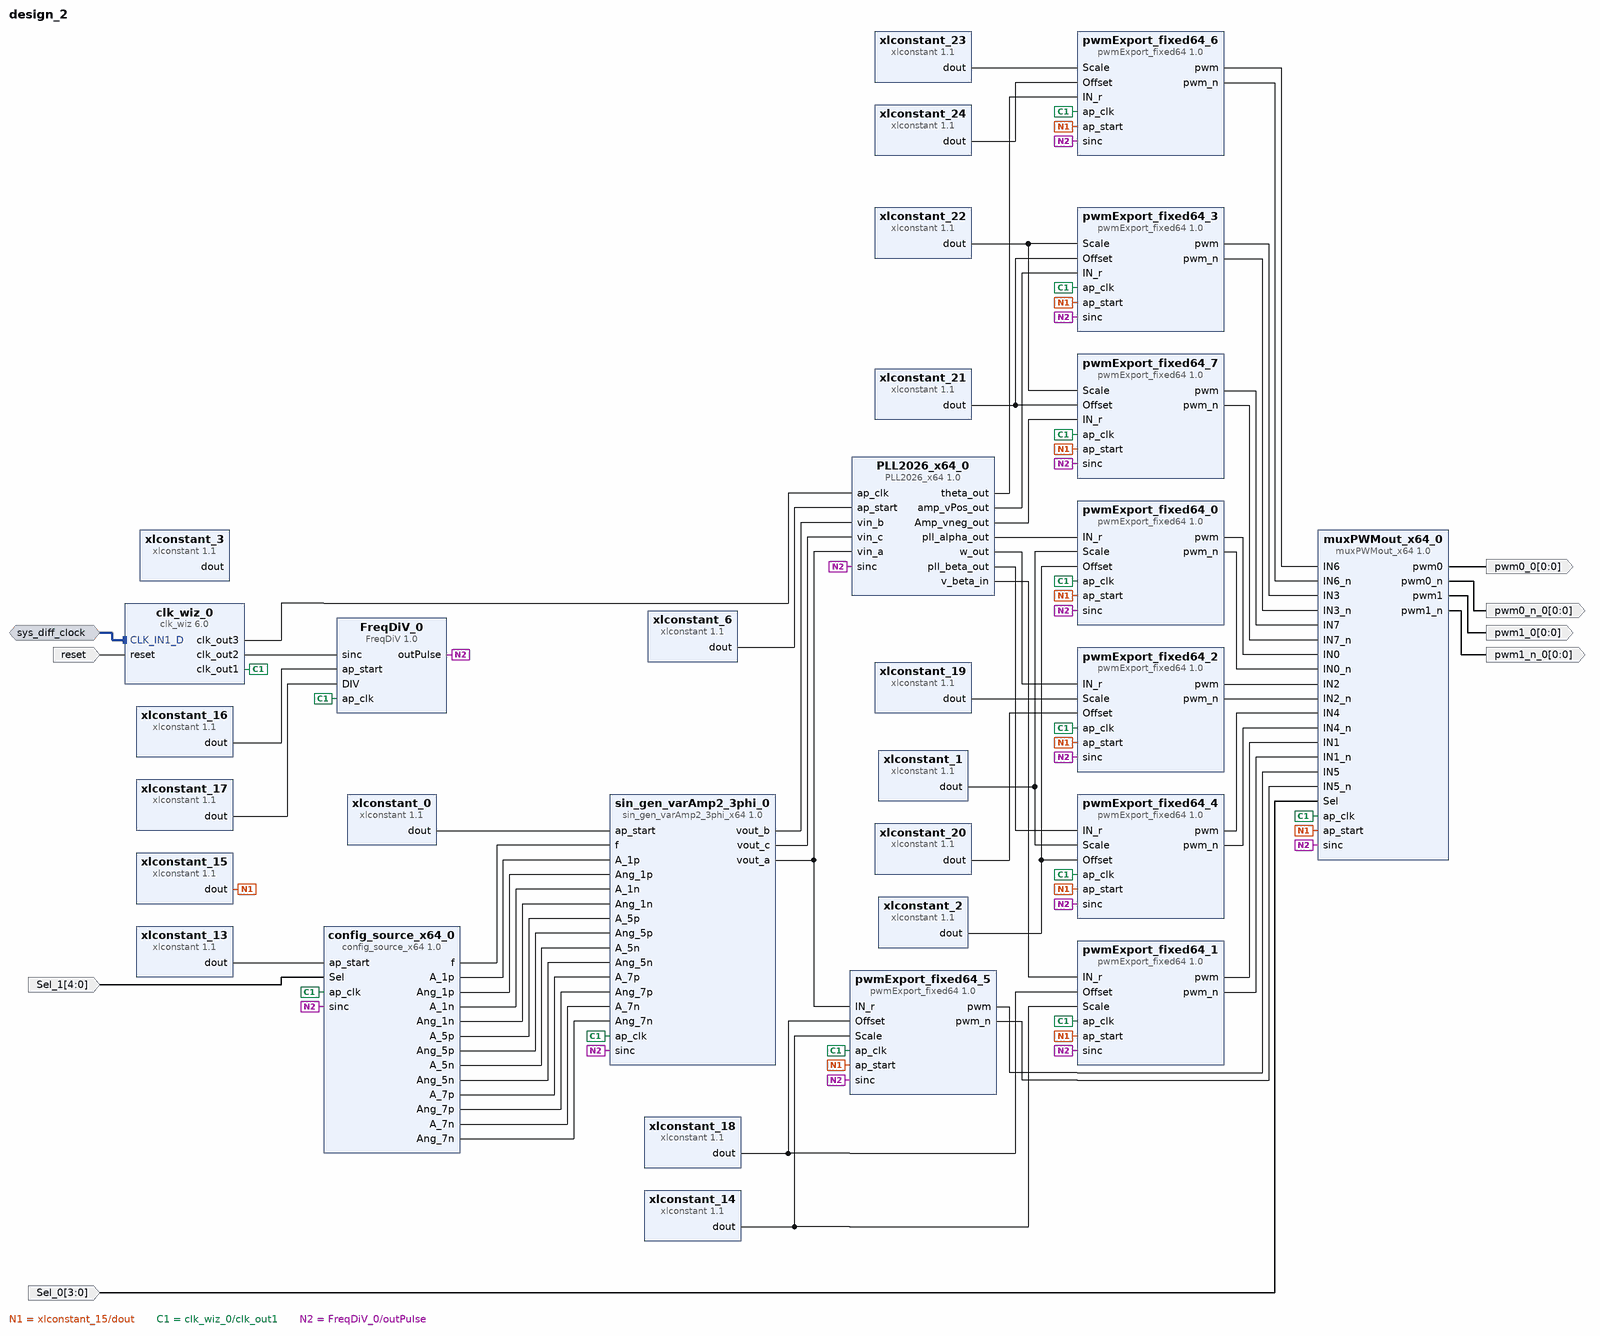
[diagram p0: block diagram of the top level]
# Vivado block design design_2, xc7a200tfbg676-2, Vivado 2020.2
create_bd_design design_2

create_bd_intf_port -mode Slave -vlnv xilinx.com:interface:diff_clock_rtl:1.0 sys_diff_clock
set_property -dict {CONFIG.FREQ_HZ 200000000} [get_bd_intf_ports sys_diff_clock]
create_bd_port -dir I -from 3 -to 0 Sel_0
create_bd_port -dir I -from 4 -to 0 Sel_1
create_bd_port -dir O -from 0 -to 0 pwm0_0
create_bd_port -dir O -from 0 -to 0 pwm0_n_0
create_bd_port -dir O -from 0 -to 0 pwm1_0
create_bd_port -dir O -from 0 -to 0 pwm1_n_0
create_bd_port -dir I -type rst reset
set_property -dict {CONFIG.POLARITY ACTIVE_HIGH} [get_bd_ports reset]

create_bd_cell -type ip -vlnv xilinx.com:ip:xlconstant:1.1 xlconstant_0
create_bd_cell -type ip -vlnv xilinx.com:ip:xlconstant:1.1 xlconstant_3
set_property -dict {CONFIG.CONST_VAL 0x19000000000000 CONFIG.CONST_WIDTH 64} [get_bd_cells xlconstant_3]
create_bd_cell -type ip -vlnv xilinx.com:ip:xlconstant:1.1 xlconstant_6
create_bd_cell -type ip -vlnv xilinx.com:ip:clk_wiz:6.0 clk_wiz_0
set_property -dict [list \
  CONFIG.CLKOUT1_JITTER 112.316 \
  CONFIG.CLKOUT1_PHASE_ERROR 89.971 \
  CONFIG.CLKOUT2_JITTER 178.053 \
  CONFIG.CLKOUT2_PHASE_ERROR 89.971 \
  CONFIG.CLKOUT2_REQUESTED_OUT_FREQ 10.000 \
  CONFIG.CLKOUT2_USED true \
  CONFIG.CLKOUT3_JITTER 129.198 \
  CONFIG.CLKOUT3_PHASE_ERROR 89.971 \
  CONFIG.CLKOUT3_REQUESTED_OUT_FREQ 50 \
  CONFIG.CLKOUT3_USED true \
  CONFIG.CLK_IN1_BOARD_INTERFACE sys_diff_clock \
  CONFIG.MMCM_CLKFBOUT_MULT_F 5.000 \
  CONFIG.MMCM_CLKOUT0_DIVIDE_F 10.000 \
  CONFIG.MMCM_CLKOUT1_DIVIDE 100 \
  CONFIG.MMCM_CLKOUT2_DIVIDE 20 \
  CONFIG.NUM_OUT_CLKS 3 \
  CONFIG.RESET_BOARD_INTERFACE reset \
  CONFIG.USE_BOARD_FLOW true \
] [get_bd_cells clk_wiz_0]
create_bd_cell -type ip -vlnv xilinx.com:user:pwmExport_fixed64:1.0 pwmExport_fixed64_0
create_bd_cell -type ip -vlnv xilinx.com:user:muxPWMout_x64:1.0 muxPWMout_x64_0
create_bd_cell -type ip -vlnv xilinx.com:user:pwmExport_fixed64:1.0 pwmExport_fixed64_1
create_bd_cell -type ip -vlnv xilinx.com:user:pwmExport_fixed64:1.0 pwmExport_fixed64_2
create_bd_cell -type ip -vlnv xilinx.com:user:pwmExport_fixed64:1.0 pwmExport_fixed64_3
create_bd_cell -type ip -vlnv xilinx.com:user:pwmExport_fixed64:1.0 pwmExport_fixed64_4
create_bd_cell -type ip -vlnv xilinx.com:user:pwmExport_fixed64:1.0 pwmExport_fixed64_5
create_bd_cell -type ip -vlnv xilinx.com:user:pwmExport_fixed64:1.0 pwmExport_fixed64_6
create_bd_cell -type ip -vlnv xilinx.com:user:pwmExport_fixed64:1.0 pwmExport_fixed64_7
create_bd_cell -type ip -vlnv xilinx.com:ip:xlconstant:1.1 xlconstant_15
create_bd_cell -type ip -vlnv xilinx.com:user:FreqDiV:1.0 FreqDiV_0
create_bd_cell -type ip -vlnv xilinx.com:ip:xlconstant:1.1 xlconstant_16
create_bd_cell -type ip -vlnv xilinx.com:ip:xlconstant:1.1 xlconstant_17
set_property -dict {CONFIG.CONST_VAL 10 CONFIG.CONST_WIDTH 32} [get_bd_cells xlconstant_17]
create_bd_cell -type ip -vlnv xilinx.com:user:config_source_x64:1.0 config_source_x64_0
create_bd_cell -type ip -vlnv xilinx.com:ip:xlconstant:1.1 xlconstant_13
create_bd_cell -type ip -vlnv xilinx.com:ip:xlconstant:1.1 xlconstant_1
set_property -dict {CONFIG.CONST_VAL 0x55000000000000 CONFIG.CONST_WIDTH 64} [get_bd_cells xlconstant_1]
create_bd_cell -type ip -vlnv xilinx.com:ip:xlconstant:1.1 xlconstant_2
set_property -dict {CONFIG.CONST_VAL 0 CONFIG.CONST_WIDTH 64} [get_bd_cells xlconstant_2]
create_bd_cell -type ip -vlnv xilinx.com:ip:xlconstant:1.1 xlconstant_14
set_property -dict {CONFIG.CONST_VAL 0x1800000000000 CONFIG.CONST_WIDTH 64} [get_bd_cells xlconstant_14]
create_bd_cell -type ip -vlnv xilinx.com:ip:xlconstant:1.1 xlconstant_18
set_property -dict {CONFIG.CONST_VAL 0 CONFIG.CONST_WIDTH 64} [get_bd_cells xlconstant_18]
create_bd_cell -type ip -vlnv xilinx.com:ip:xlconstant:1.1 xlconstant_19
set_property -dict {CONFIG.CONST_VAL 0xcccccccccccc CONFIG.CONST_WIDTH 64} [get_bd_cells xlconstant_19]
create_bd_cell -type ip -vlnv xilinx.com:ip:xlconstant:1.1 xlconstant_20
set_property -dict {CONFIG.CONST_VAL 0xfed4000000000000 CONFIG.CONST_WIDTH 64} [get_bd_cells xlconstant_20]
create_bd_cell -type ip -vlnv xilinx.com:ip:xlconstant:1.1 xlconstant_21
set_property -dict {CONFIG.CONST_VAL 0x3553f7ced9168 CONFIG.CONST_WIDTH 64} [get_bd_cells xlconstant_21]
create_bd_cell -type ip -vlnv xilinx.com:ip:xlconstant:1.1 xlconstant_22
set_property -dict {CONFIG.CONST_VAL 0x3553f7ced9168 CONFIG.CONST_WIDTH 64} [get_bd_cells xlconstant_22]
create_bd_cell -type ip -vlnv xilinx.com:ip:xlconstant:1.1 xlconstant_23
set_property -dict {CONFIG.CONST_VAL 0x19000000000000 CONFIG.CONST_WIDTH 64} [get_bd_cells xlconstant_23]
create_bd_cell -type ip -vlnv xilinx.com:ip:xlconstant:1.1 xlconstant_24
set_property -dict {CONFIG.CONST_VAL 0xffb5000000000000 CONFIG.CONST_WIDTH 64} [get_bd_cells xlconstant_24]
create_bd_cell -type ip -vlnv xilinx.com:user:sin_gen_varAmp2_3phi_x64:1.0 sin_gen_varAmp2_3phi_0
create_bd_cell -type ip -vlnv xilinx.com:user:PLL2026_x64:1.0 PLL2026_x64_0

# ---- connections ----

connect_bd_intf_net [get_bd_intf_ports sys_diff_clock] [get_bd_intf_pins clk_wiz_0/CLK_IN1_D]
connect_bd_net [get_bd_pins xlconstant_0/dout] [get_bd_pins sin_gen_varAmp2_3phi_0/ap_start]
connect_bd_net [get_bd_pins sin_gen_varAmp2_3phi_0/vout_a] [get_bd_pins pwmExport_fixed64_5/IN_r] [get_bd_pins PLL2026_x64_0/vin_a]
connect_bd_net [get_bd_pins sin_gen_varAmp2_3phi_0/vout_b] [get_bd_pins PLL2026_x64_0/vin_b]
connect_bd_net [get_bd_pins sin_gen_varAmp2_3phi_0/vout_c] [get_bd_pins PLL2026_x64_0/vin_c]
# net xlconstant_3_dout has one end: xlconstant_3/dout
connect_bd_net [get_bd_pins xlconstant_6/dout] [get_bd_pins PLL2026_x64_0/ap_start]
connect_bd_net [get_bd_pins pwmExport_fixed64_0/pwm] [get_bd_pins muxPWMout_x64_0/IN0]
connect_bd_net [get_bd_pins pwmExport_fixed64_1/pwm] [get_bd_pins muxPWMout_x64_0/IN1]
connect_bd_net [get_bd_pins pwmExport_fixed64_2/pwm] [get_bd_pins muxPWMout_x64_0/IN2]
connect_bd_net [get_bd_pins pwmExport_fixed64_3/pwm] [get_bd_pins muxPWMout_x64_0/IN3]
connect_bd_net [get_bd_pins pwmExport_fixed64_4/pwm] [get_bd_pins muxPWMout_x64_0/IN4]
connect_bd_net [get_bd_pins pwmExport_fixed64_5/pwm] [get_bd_pins muxPWMout_x64_0/IN5]
connect_bd_net [get_bd_pins pwmExport_fixed64_6/pwm] [get_bd_pins muxPWMout_x64_0/IN6]
connect_bd_net [get_bd_pins pwmExport_fixed64_7/pwm] [get_bd_pins muxPWMout_x64_0/IN7]
connect_bd_net [get_bd_pins pwmExport_fixed64_0/pwm_n] [get_bd_pins muxPWMout_x64_0/IN0_n]
connect_bd_net [get_bd_pins pwmExport_fixed64_1/pwm_n] [get_bd_pins muxPWMout_x64_0/IN1_n]
connect_bd_net [get_bd_pins pwmExport_fixed64_2/pwm_n] [get_bd_pins muxPWMout_x64_0/IN2_n]
connect_bd_net [get_bd_pins pwmExport_fixed64_3/pwm_n] [get_bd_pins muxPWMout_x64_0/IN3_n]
connect_bd_net [get_bd_pins pwmExport_fixed64_4/pwm_n] [get_bd_pins muxPWMout_x64_0/IN4_n]
connect_bd_net [get_bd_pins pwmExport_fixed64_5/pwm_n] [get_bd_pins muxPWMout_x64_0/IN5_n]
connect_bd_net [get_bd_pins pwmExport_fixed64_6/pwm_n] [get_bd_pins muxPWMout_x64_0/IN6_n]
connect_bd_net [get_bd_pins pwmExport_fixed64_7/pwm_n] [get_bd_pins muxPWMout_x64_0/IN7_n]
connect_bd_net -net Sel_0_1 [get_bd_ports Sel_0] [get_bd_pins muxPWMout_x64_0/Sel]
connect_bd_net [get_bd_pins xlconstant_15/dout] \
  [get_bd_pins muxPWMout_x64_0/ap_start] [get_bd_pins pwmExport_fixed64_0/ap_start] \
  [get_bd_pins pwmExport_fixed64_1/ap_start] [get_bd_pins pwmExport_fixed64_2/ap_start] \
  [get_bd_pins pwmExport_fixed64_3/ap_start] [get_bd_pins pwmExport_fixed64_4/ap_start] \
  [get_bd_pins pwmExport_fixed64_5/ap_start] [get_bd_pins pwmExport_fixed64_6/ap_start] \
  [get_bd_pins pwmExport_fixed64_7/ap_start]
connect_bd_net [get_bd_pins clk_wiz_0/clk_out1] \
  [get_bd_pins pwmExport_fixed64_0/ap_clk] [get_bd_pins pwmExport_fixed64_1/ap_clk] [get_bd_pins pwmExport_fixed64_2/ap_clk] \
  [get_bd_pins pwmExport_fixed64_3/ap_clk] [get_bd_pins pwmExport_fixed64_4/ap_clk] [get_bd_pins pwmExport_fixed64_5/ap_clk] \
  [get_bd_pins pwmExport_fixed64_6/ap_clk] [get_bd_pins pwmExport_fixed64_7/ap_clk] [get_bd_pins FreqDiV_0/ap_clk] \
  [get_bd_pins muxPWMout_x64_0/ap_clk] [get_bd_pins config_source_x64_0/ap_clk] [get_bd_pins sin_gen_varAmp2_3phi_0/ap_clk]
connect_bd_net [get_bd_pins xlconstant_16/dout] [get_bd_pins FreqDiV_0/ap_start]
connect_bd_net [get_bd_pins clk_wiz_0/clk_out2] [get_bd_pins FreqDiV_0/sinc]
connect_bd_net [get_bd_pins xlconstant_17/dout] [get_bd_pins FreqDiV_0/DIV]
connect_bd_net [get_bd_pins FreqDiV_0/outPulse] \
  [get_bd_pins pwmExport_fixed64_0/sinc] [get_bd_pins pwmExport_fixed64_1/sinc] [get_bd_pins pwmExport_fixed64_2/sinc] \
  [get_bd_pins pwmExport_fixed64_3/sinc] [get_bd_pins pwmExport_fixed64_4/sinc] [get_bd_pins pwmExport_fixed64_5/sinc] \
  [get_bd_pins pwmExport_fixed64_6/sinc] [get_bd_pins pwmExport_fixed64_7/sinc] [get_bd_pins muxPWMout_x64_0/sinc] \
  [get_bd_pins config_source_x64_0/sinc] [get_bd_pins sin_gen_varAmp2_3phi_0/sinc] [get_bd_pins PLL2026_x64_0/sinc]
connect_bd_net [get_bd_pins config_source_x64_0/f] [get_bd_pins sin_gen_varAmp2_3phi_0/f]
connect_bd_net [get_bd_pins config_source_x64_0/A_1p] [get_bd_pins sin_gen_varAmp2_3phi_0/A_1p]
connect_bd_net [get_bd_pins config_source_x64_0/Ang_1p] [get_bd_pins sin_gen_varAmp2_3phi_0/Ang_1p]
connect_bd_net [get_bd_pins config_source_x64_0/A_1n] [get_bd_pins sin_gen_varAmp2_3phi_0/A_1n]
connect_bd_net [get_bd_pins config_source_x64_0/Ang_1n] [get_bd_pins sin_gen_varAmp2_3phi_0/Ang_1n]
connect_bd_net [get_bd_pins config_source_x64_0/A_5p] [get_bd_pins sin_gen_varAmp2_3phi_0/A_5p]
connect_bd_net [get_bd_pins config_source_x64_0/Ang_5p] [get_bd_pins sin_gen_varAmp2_3phi_0/Ang_5p]
connect_bd_net [get_bd_pins config_source_x64_0/A_5n] [get_bd_pins sin_gen_varAmp2_3phi_0/A_5n]
connect_bd_net [get_bd_pins config_source_x64_0/Ang_5n] [get_bd_pins sin_gen_varAmp2_3phi_0/Ang_5n]
connect_bd_net [get_bd_pins config_source_x64_0/A_7p] [get_bd_pins sin_gen_varAmp2_3phi_0/A_7p]
connect_bd_net [get_bd_pins config_source_x64_0/Ang_7p] [get_bd_pins sin_gen_varAmp2_3phi_0/Ang_7p]
connect_bd_net [get_bd_pins config_source_x64_0/A_7n] [get_bd_pins sin_gen_varAmp2_3phi_0/A_7n]
connect_bd_net [get_bd_pins config_source_x64_0/Ang_7n] [get_bd_pins sin_gen_varAmp2_3phi_0/Ang_7n]
connect_bd_net -net Sel_1_1 [get_bd_ports Sel_1] [get_bd_pins config_source_x64_0/Sel]
connect_bd_net [get_bd_pins xlconstant_13/dout] [get_bd_pins config_source_x64_0/ap_start]
connect_bd_net [get_bd_pins PLL2026_x64_0/pll_alpha_out] [get_bd_pins pwmExport_fixed64_0/IN_r]
connect_bd_net [get_bd_pins xlconstant_1/dout] [get_bd_pins pwmExport_fixed64_0/Scale] [get_bd_pins pwmExport_fixed64_4/Scale]
connect_bd_net [get_bd_pins xlconstant_2/dout] [get_bd_pins pwmExport_fixed64_0/Offset] [get_bd_pins pwmExport_fixed64_4/Offset]
connect_bd_net [get_bd_pins PLL2026_x64_0/pll_beta_out] [get_bd_pins pwmExport_fixed64_4/IN_r]
connect_bd_net [get_bd_pins xlconstant_18/dout] [get_bd_pins pwmExport_fixed64_1/Offset] [get_bd_pins pwmExport_fixed64_5/Offset]
connect_bd_net [get_bd_pins xlconstant_14/dout] [get_bd_pins pwmExport_fixed64_1/Scale] [get_bd_pins pwmExport_fixed64_5/Scale]
connect_bd_net [get_bd_pins PLL2026_x64_0/v_beta_in] [get_bd_pins pwmExport_fixed64_1/IN_r]
connect_bd_net [get_bd_pins xlconstant_19/dout] [get_bd_pins pwmExport_fixed64_2/Scale]
connect_bd_net [get_bd_pins xlconstant_20/dout] [get_bd_pins pwmExport_fixed64_2/Offset]
connect_bd_net [get_bd_pins PLL2026_x64_0/w_out] [get_bd_pins pwmExport_fixed64_2/IN_r]
connect_bd_net [get_bd_pins xlconstant_22/dout] [get_bd_pins pwmExport_fixed64_3/Scale] [get_bd_pins pwmExport_fixed64_7/Scale]
connect_bd_net [get_bd_pins xlconstant_21/dout] [get_bd_pins pwmExport_fixed64_3/Offset] [get_bd_pins pwmExport_fixed64_7/Offset]
connect_bd_net [get_bd_pins PLL2026_x64_0/amp_vPos_out] [get_bd_pins pwmExport_fixed64_3/IN_r]
connect_bd_net [get_bd_pins PLL2026_x64_0/Amp_vneg_out] [get_bd_pins pwmExport_fixed64_7/IN_r]
connect_bd_net [get_bd_pins xlconstant_23/dout] [get_bd_pins pwmExport_fixed64_6/Scale]
connect_bd_net [get_bd_pins xlconstant_24/dout] [get_bd_pins pwmExport_fixed64_6/Offset]
connect_bd_net [get_bd_pins PLL2026_x64_0/theta_out] [get_bd_pins pwmExport_fixed64_6/IN_r]
connect_bd_net [get_bd_pins muxPWMout_x64_0/pwm0] [get_bd_ports pwm0_0]
connect_bd_net [get_bd_pins muxPWMout_x64_0/pwm0_n] [get_bd_ports pwm0_n_0]
connect_bd_net [get_bd_pins muxPWMout_x64_0/pwm1] [get_bd_ports pwm1_0]
connect_bd_net [get_bd_pins muxPWMout_x64_0/pwm1_n] [get_bd_ports pwm1_n_0]
connect_bd_net [get_bd_pins clk_wiz_0/clk_out3] [get_bd_pins PLL2026_x64_0/ap_clk]
connect_bd_net [get_bd_ports reset] [get_bd_pins clk_wiz_0/reset]

validate_bd_design
save_bd_design
